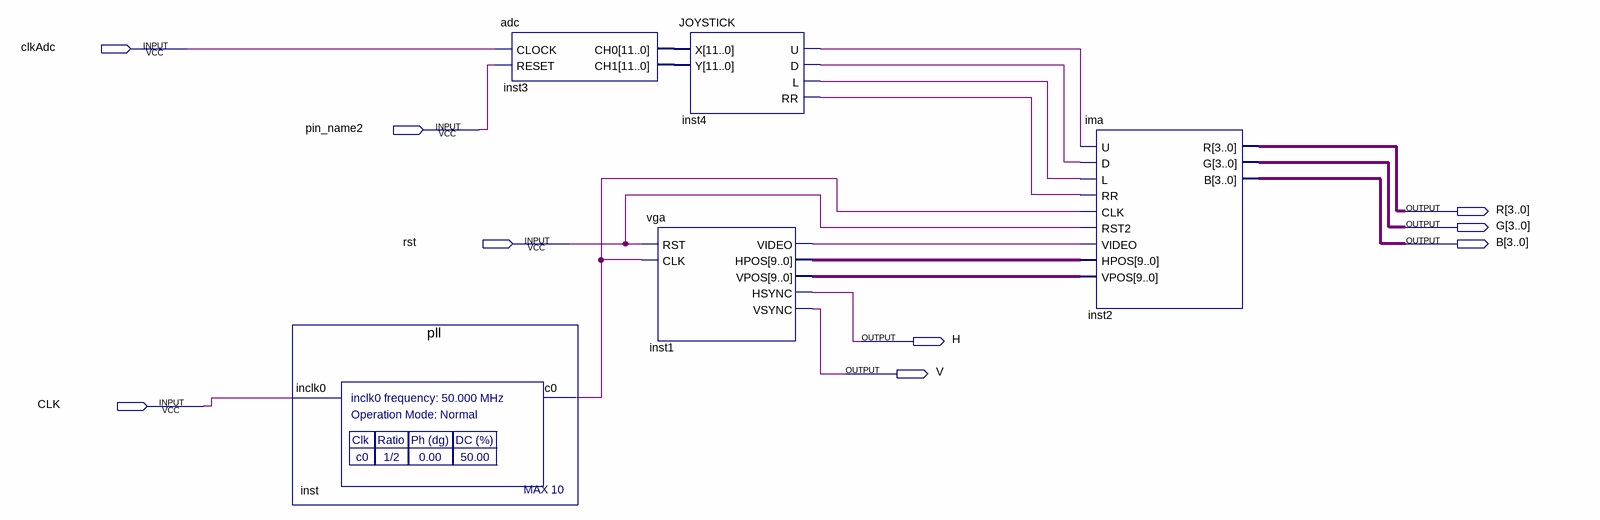
[diagram p0: schematic sheet]
// Quartus schematic P9.bdf as structural Verilog: 5 symbols, 9 pins
module P9 (
  input  clkAdc,
  input  pin_name2,
  input  rst,
  input  CLK,
  output [3:0] R,
  output [3:0] G,
  output [3:0] B,
  output H,
  output V
);

  wire inst1_video, inst4_d, inst4_l, inst4_rr, inst4_u, inst_c0;
  wire [9:0] inst1_hpos, inst1_vpos;
  wire [11:0] inst3_ch0, inst3_ch1;

  pll inst (.inclk0(CLK), .c0(inst_c0));
  adc inst3 (.CLOCK(clkAdc), .RESET(pin_name2), .CH0(inst3_ch0), .CH1(inst3_ch1));
  vga inst1 (.RST(rst), .CLK(inst_c0), .VIDEO(inst1_video), .HPOS(inst1_hpos), .VPOS(inst1_vpos), .HSYNC(H), .VSYNC(V));
  JOYSTICK inst4 (.X(inst3_ch0), .Y(inst3_ch1), .U(inst4_u), .D(inst4_d), .L(inst4_l), .RR(inst4_rr));
  ima inst2 (
    .U(inst4_u), .D(inst4_d), .L(inst4_l), .RR(inst4_rr), .CLK(inst_c0), .RST2(rst), .VIDEO(inst1_video),
    .HPOS(inst1_hpos), .VPOS(inst1_vpos), .R(R), .G(G), .B(B));
endmodule
